# Altium schematic sheet CH32L103C8T-R0.SchDoc
size 304 x 254 mm; SheetNumber: 1; SheetTotal: 1
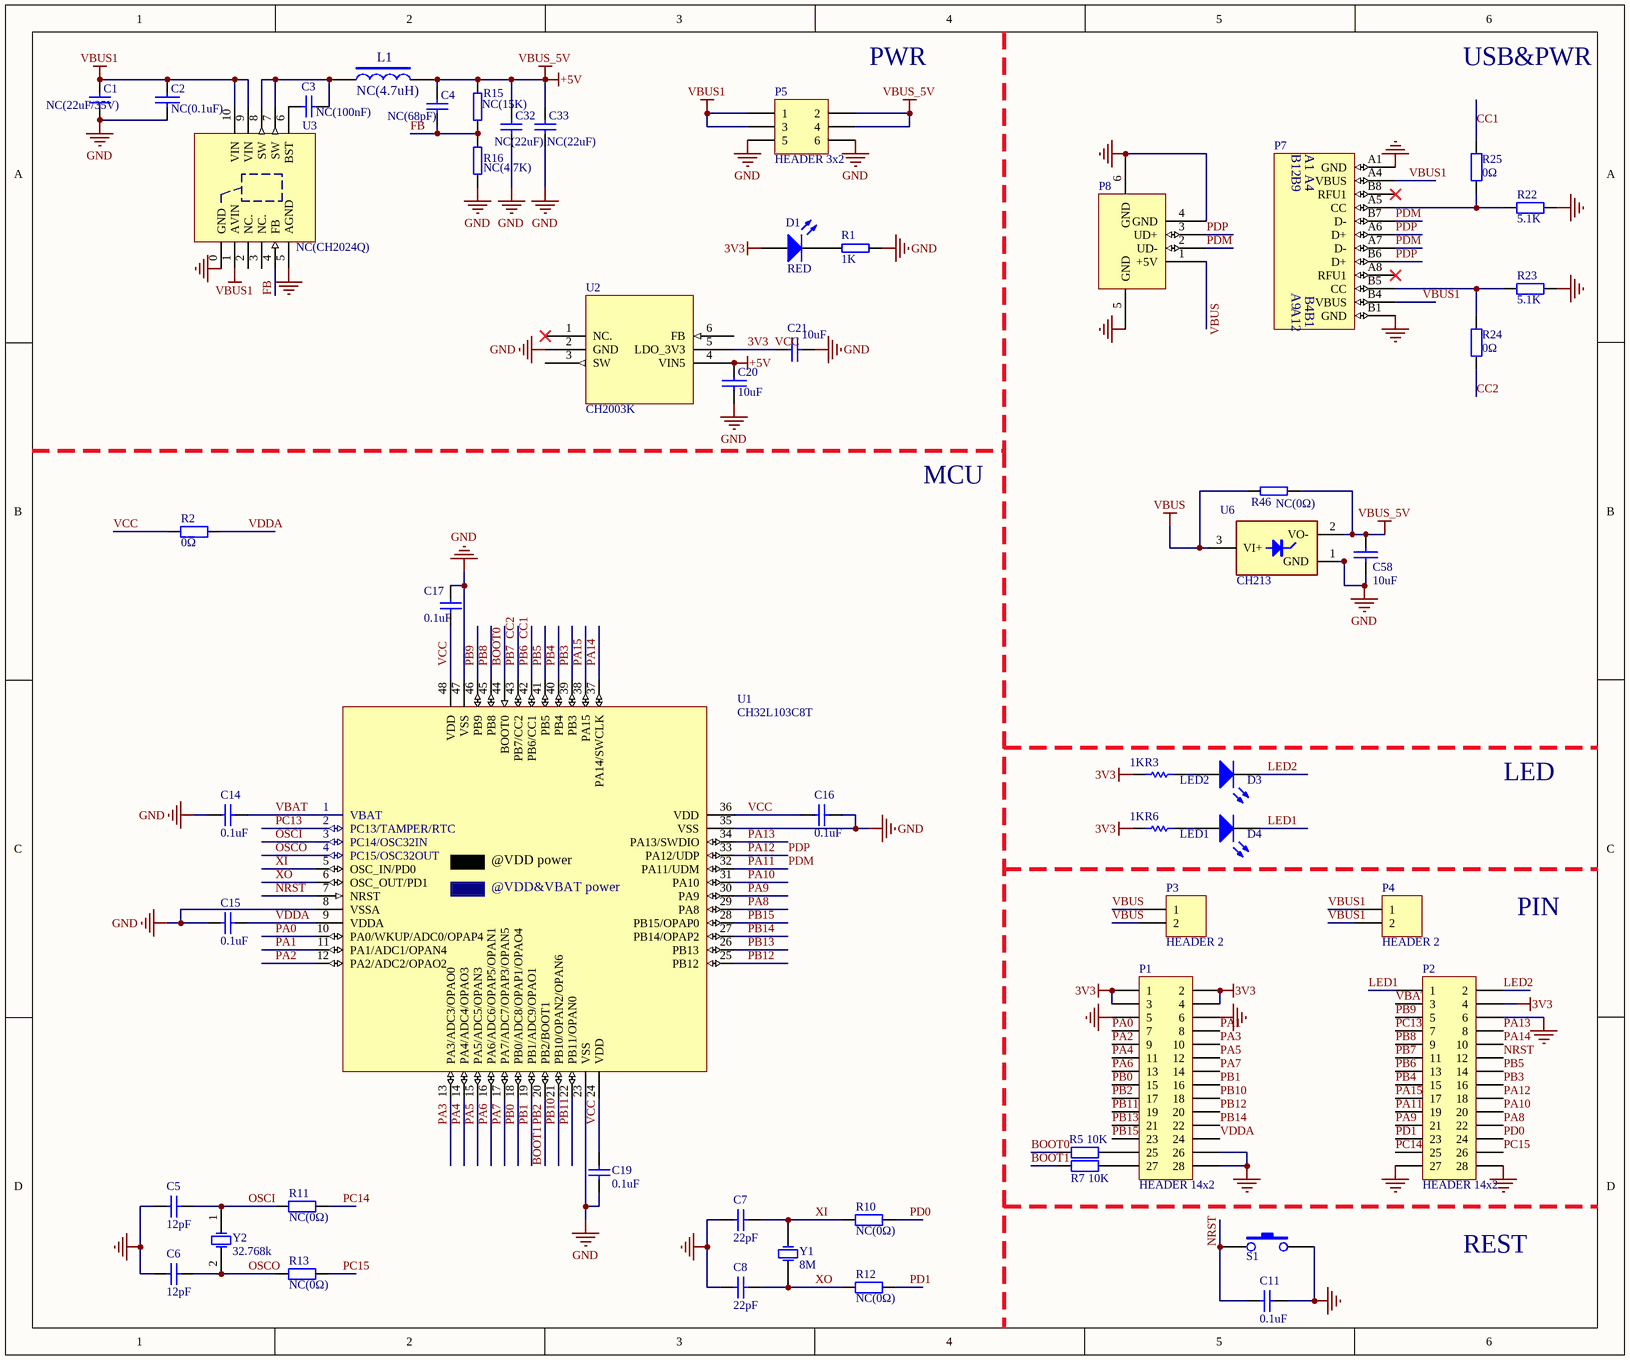
[diagram p0: CH32L103C8T-R0.SchDoc]

## Parts
C1  NC(22uF/35V)  [0805_C]
C2  NC(0.1uF)  [0402_C]
C3  NC(100nF)  [0402_C]
C4  NC(68pF)  [0402_C]
C5  12pF  [0402_C]
C6  12pF  [0402_C]
C7  22pF  [0402_C]
C8  22pF  [0402_C]
C11  0.1uF  [0402_C]
C14  0.1uF  [0402_C]
C15  0.1uF  [0402_C]
C16  0.1uF  [0402_C]
C17  0.1uF  [0402_C]
C19  0.1uF  [0402_C]
C20  10uF  [0603_C]
C21  10uF  [0603_C]
C32  NC(22uF)  [0805_C]
C33  NC(22uF)  [0805_C]
C58  10uF  [0603_C]
D1  RED  [0603+]
D3  LED2  [0603+]
D4  LED1  [0603+]
L1  NC(4.7uH)  [IND-SMD_L7.0-W6.6]
P1  HEADER 14x2  [IDC28-2.54MM]
P2  HEADER 14x2  [IDC28-2.54MM]
P3  HEADER 2  [SIP2-2.54mm]
P4  HEADER 2  [SIP2-2.54mm]
P5  HEADER 3x2  [IDC6-2.54mm]
P7  TYPE-C  [TYPE-C-Receptacle-2.0]  (value not drawn)
P8  USB_A  [USBAF]  (value not drawn)
R1  1K  [0402]
R2  0Ω  [0402]
R3  1K  [0402]
R5  10K  [0402]
R6  1K  [0402]
R7  10K  [0402]
R10  NC(0Ω)  [0402]
R11  NC(0Ω)  [0402]
R12  NC(0Ω)  [0402]
R13  NC(0Ω)  [0402]
R15  NC(15K)  [0402]
R16  NC(4.7K)  [0402]
R22  5.1K  [0402]
R23  5.1K  [0402]
R24  0Ω  [0402]
R25  0Ω  [0402]
R46  NC(0Ω)  [0402]
S1  KEY  [SMD_6.1x3.65x2.5mm-KEY]  (value not drawn)
U1  CH32L103C8T  [LQFP48]
U2  CH2003K  [SOT-23-6]
U3  NC(CH2024Q)  [DFN10_3X3]
U6  CH213  [SOT-23-3]
Y1  8M  [XT3225]
Y2  32.768k  [FC-135]

## Nets
3V3: C16.1 C17.2 C19.2 C21.2 D1.1(A) P1.1 P1.2 P1.3 P1.4 P2.4 R2.1 R3.1 R6.1 U1.24(VDD) U1.36(VDD) U1.48(VDD) U2.5(LDO_3V3)  [also labelled VCC]
+5V: C4.1 C20.2 C32.2 C33.2 C58.1 L1.2 P5.2 P5.4 R15.2 R46.1 U2.4(VIN5) U6.2(VO-)  [also labelled VBUS_5V]
GND: C1.1 C2.1 C5.2 C6.2 C7.1 C8.1 C11.1 C14.2 C15.2 C16.2 C17.1 C19.1 C20.1 C21.1 C32.1 C33.1 C58.2 P1.5 P1.6 P1.26 P1.28 P2.6 P2.27 P2.28 P5.5 P5.6 P7.A1(GND) P7.B1(GND) P8.4(GND) P8.5(GND) P8.6(GND) R1.2 R16.1 R22.2 R23.2 S1.2 U1.8(VSSA) U1.23(VSS) U1.35(VSS) U1.47(VSS) U2.2(GND) U3.0(GND) U3.5(AGND) U6.1(GND)
VBUS: P3.1 P3.2 P8.1(+5V) R46.2 U6.3(VI+)
VBUS1: C1.2 C2.2 P4.1 P4.2 P5.1 P5.3 P7.A4(VBUS) P7.B4(VBUS) U3.1(AVIN) U3.9(VIN) U3.10(VIN)
BOOT0: R5.1 U1.44(BOOT0)
BOOT1: P1.17 R7.1 U1.20(PB2/BOOT1)  [also labelled PB2]
CC1: P2.13 R25.2 U1.42(PB6/CC1)  [also labelled PB6]
CC2: P2.11 R24.1 U1.43(PB7/CC2)  [also labelled PB7]
FB: C4.2 R15.1 R16.2 U3.4(FB)
LED1: D4.2(K) P2.1
LED2: D3.2(K) P2.2
NRST: C11.2 P2.12 S1.1 U1.7(NRST)
OSCI: C5.1 R11.2 U1.3(PC14/OSC32IN) Y2.1(OSC1)
OSCO: C6.1 R13.2 U1.4(PC15/OSC32OUT) Y2.2(OSC2)
PA0: P1.7 U1.10(PA0/WKUP/ADC0/OPAP4)
PA1: P1.8 U1.11(PA1/ADC1/OPAN4)
PA2: P1.9 U1.12(PA2/ADC2/OPAO2)
PA3: P1.10 U1.13(PA3/ADC3/OPAO0)
PA4: P1.11 U1.14(PA4/ADC4/OPAO3)
PA5: P1.12 U1.15(PA5/ADC5/OPAN3)
PA6: P1.13 U1.16(PA6/ADC6/OPAP5/OPAN1)
PA7: P1.14 U1.17(PA7/ADC7/OPAP3/OPAN5)
PA8: P2.22 U1.29(PA8)
PA9: P2.21 U1.30(PA9)
PA10: P2.20 U1.31(PA10)
PA11: P2.19 P7.A7(D-) P7.B7(D-) P8.2(UD-) U1.32(PA11/UDM)  [also labelled PDM]
PA12: P2.18 P7.A6(D+) P7.B6(D+) P8.3(UD+) U1.33(PA12/UDP)  [also labelled PDP]
PA13: P2.8 U1.34(PA13/SWDIO)
PA14: P2.10 U1.37(PA14/SWCLK)
PA15: P2.17 U1.38(PA15)
PB0: P1.15 U1.18(PB0/ADC8/OPAP1/OPAO4)
PB1: P1.16 U1.19(PB1/ADC9/OPAO1)
PB3: P2.16 U1.39(PB3)
PB4: P2.15 U1.40(PB4)
PB5: P2.14 U1.41(PB5)
PB8: P2.9 U1.45(PB8)
PB9: P2.5 U1.46(PB9)
PB10: P1.18 U1.21(PB10/OPAN2/OPAN6)
PB11: P1.19 U1.22(PB11/OPAN0)
PB12: P1.20 U1.25(PB12)
PB13: P1.21 U1.26(PB13)
PB14: P1.22 U1.27(PB14/OPAP2)
PB15: P1.23 U1.28(PB15/OPAP0)
PC13: P2.7 U1.2(PC13/TAMPER/RTC)
PC14: P2.25 R11.1
PC15: P2.26 R13.1
PD0: P2.24 R10.1
PD1: P2.23 R12.1
VBAT: C14.1 P2.3 U1.1(VBAT)
VDDA: C15.1 P1.24 R2.2 U1.9(VDDA)
XI: C7.2 R10.2 U1.5(OSC_IN/PD0) Y1.3(OSC2)
XO: C8.2 R12.2 U1.6(OSC_OUT/PD1) Y1.1(OSC1)
NetC3_1: C3.1 U3.6(BST)
NetC3_2: C3.2 L1.1 U3.7(SW) U3.8(SW)
NetD1_2: D1.2(K) R1.1
NetD3_1: D3.1(A) R3.2
NetD4_1: D4.1(A) R6.2
NetP1_25: P1.25 R5.2
NetP1_27: P1.27 R7.2
NetP7_A5: P7.A5(CC) R22.1 R25.1
NetP7_B5: P7.B5(CC) R23.1 R24.2

Not connected (* = marked no-connect by the designer): P7 A8(RFU1)* B8(RFU1)*; U2 1(NC.)* 3(SW) 6(FB); U3 2(NC.) 3(NC.)

## Notes on the sheet
- PWR
- USB&PWR
- MCU
- LED
- PIN
- REST
- (in symbol CH32L103C8T) @VDD power; @VDD&VBAT power
- (in symbol TYPE-C1) B12; B9; A9; A12

## Library data of the parts
C1 C4 C32 C33 = 0603 100nF (104) 10% 50V: 贴片电容; ComponentLink1Description: 供应商链接; ComponentLink1URL: http://www.szlcsc.com/product/details_15331.html; Package: 0603; Supplier: LC; SuppliersPartNumber: C14663
C2 C20 C21 C58 = CAP: Capacitor
C3 = 0603 1uF (105) 10% 50V: 贴片电容; ComponentLink1Description: 供应商链接; ComponentLink1URL: http://www.szlcsc.com/product/details_16531.html; Package: 0603; Supplier: LC; SuppliersPartNumber: C15849
C5-C8 C11 = Cap: Capacitor; Published: 8-Jun-2000; LatestRevisionDate: 17-Jul-2002; LatestRevisionNote: Re-released for DXP Platform.; PackageReference: RAD-0.3; Publisher: Altium Limited
  C11: Value: 0.1uF
C14-C17 C19 = Cap: Capacitor; Value: 15pF; Published: 8-Jun-2000; LatestRevisionDate: 17-Jul-2002; LatestRevisionNote: Re-released for DXP Platform.; PackageReference: RAD-0.3; Publisher: Altium Limited
D1 D3 D4 = LED0: Typical INFRARED GaAs LED; Published: 8-Jun-2000; LatestRevisionDate: 08-Jul-2005; LatestRevisionNote: Mech Layer 1 removed.; PackageReference: LED-0; Publisher: Altium Limited
  D1: PackageDescription: LED; 2 Leads
L1 = INDUCTOR
P1 P2 = HEADER 14x2: Header, 14-Pin, Dual row
P3 P4 = HEADER 2: Header, 2-Pin
P5 = HEADER 3x2: Header, 3-Pin, Dual row
P7 = TYPE-C1
P8 = USB: USB Port
R1 R15 R16 R46 = RES
R2 R5 R7 R10-R13 R22-R25 = Res2: Resistor
  R5 R7: Published: 8-Jun-2000; LatestRevisionDate: 17-Jul-2002; LatestRevisionNote: Re-released for DXP Platform.; PackageReference: AXIAL-0.4; Publisher: Altium Limited; Value: 10K
R3 R6 = Res Semi: Semiconductor Resistor
U1 = CH32L103C8T: RISC-V LMD-MCU, 96MHz, USB, Type-C/PD, CAN, OPA, lower power
U2 = CH2003K: Step-Down DC-DC Converter, 5V input, FB 0.6V, 800mA output, with LDO 3.3V * 200mA
U3 = CH2024Q: Step-Down DC-DC Converter, 28V input, FB 1.2V, 3A output
U6 = CH213E: Ideal Diode 5V*1A
Y1 Y2 = XTAL: Crystal Oscillator; Published: 8-Jun-2000; LatestRevisionDate: 17-Jul-2002; LatestRevisionNote: Re-released for DXP Platform.; PackageReference: R38; Publisher: Altium Limited